# Altium schematic sheet USBhub-CH634M-R0-1v1.SchDoc
size A3
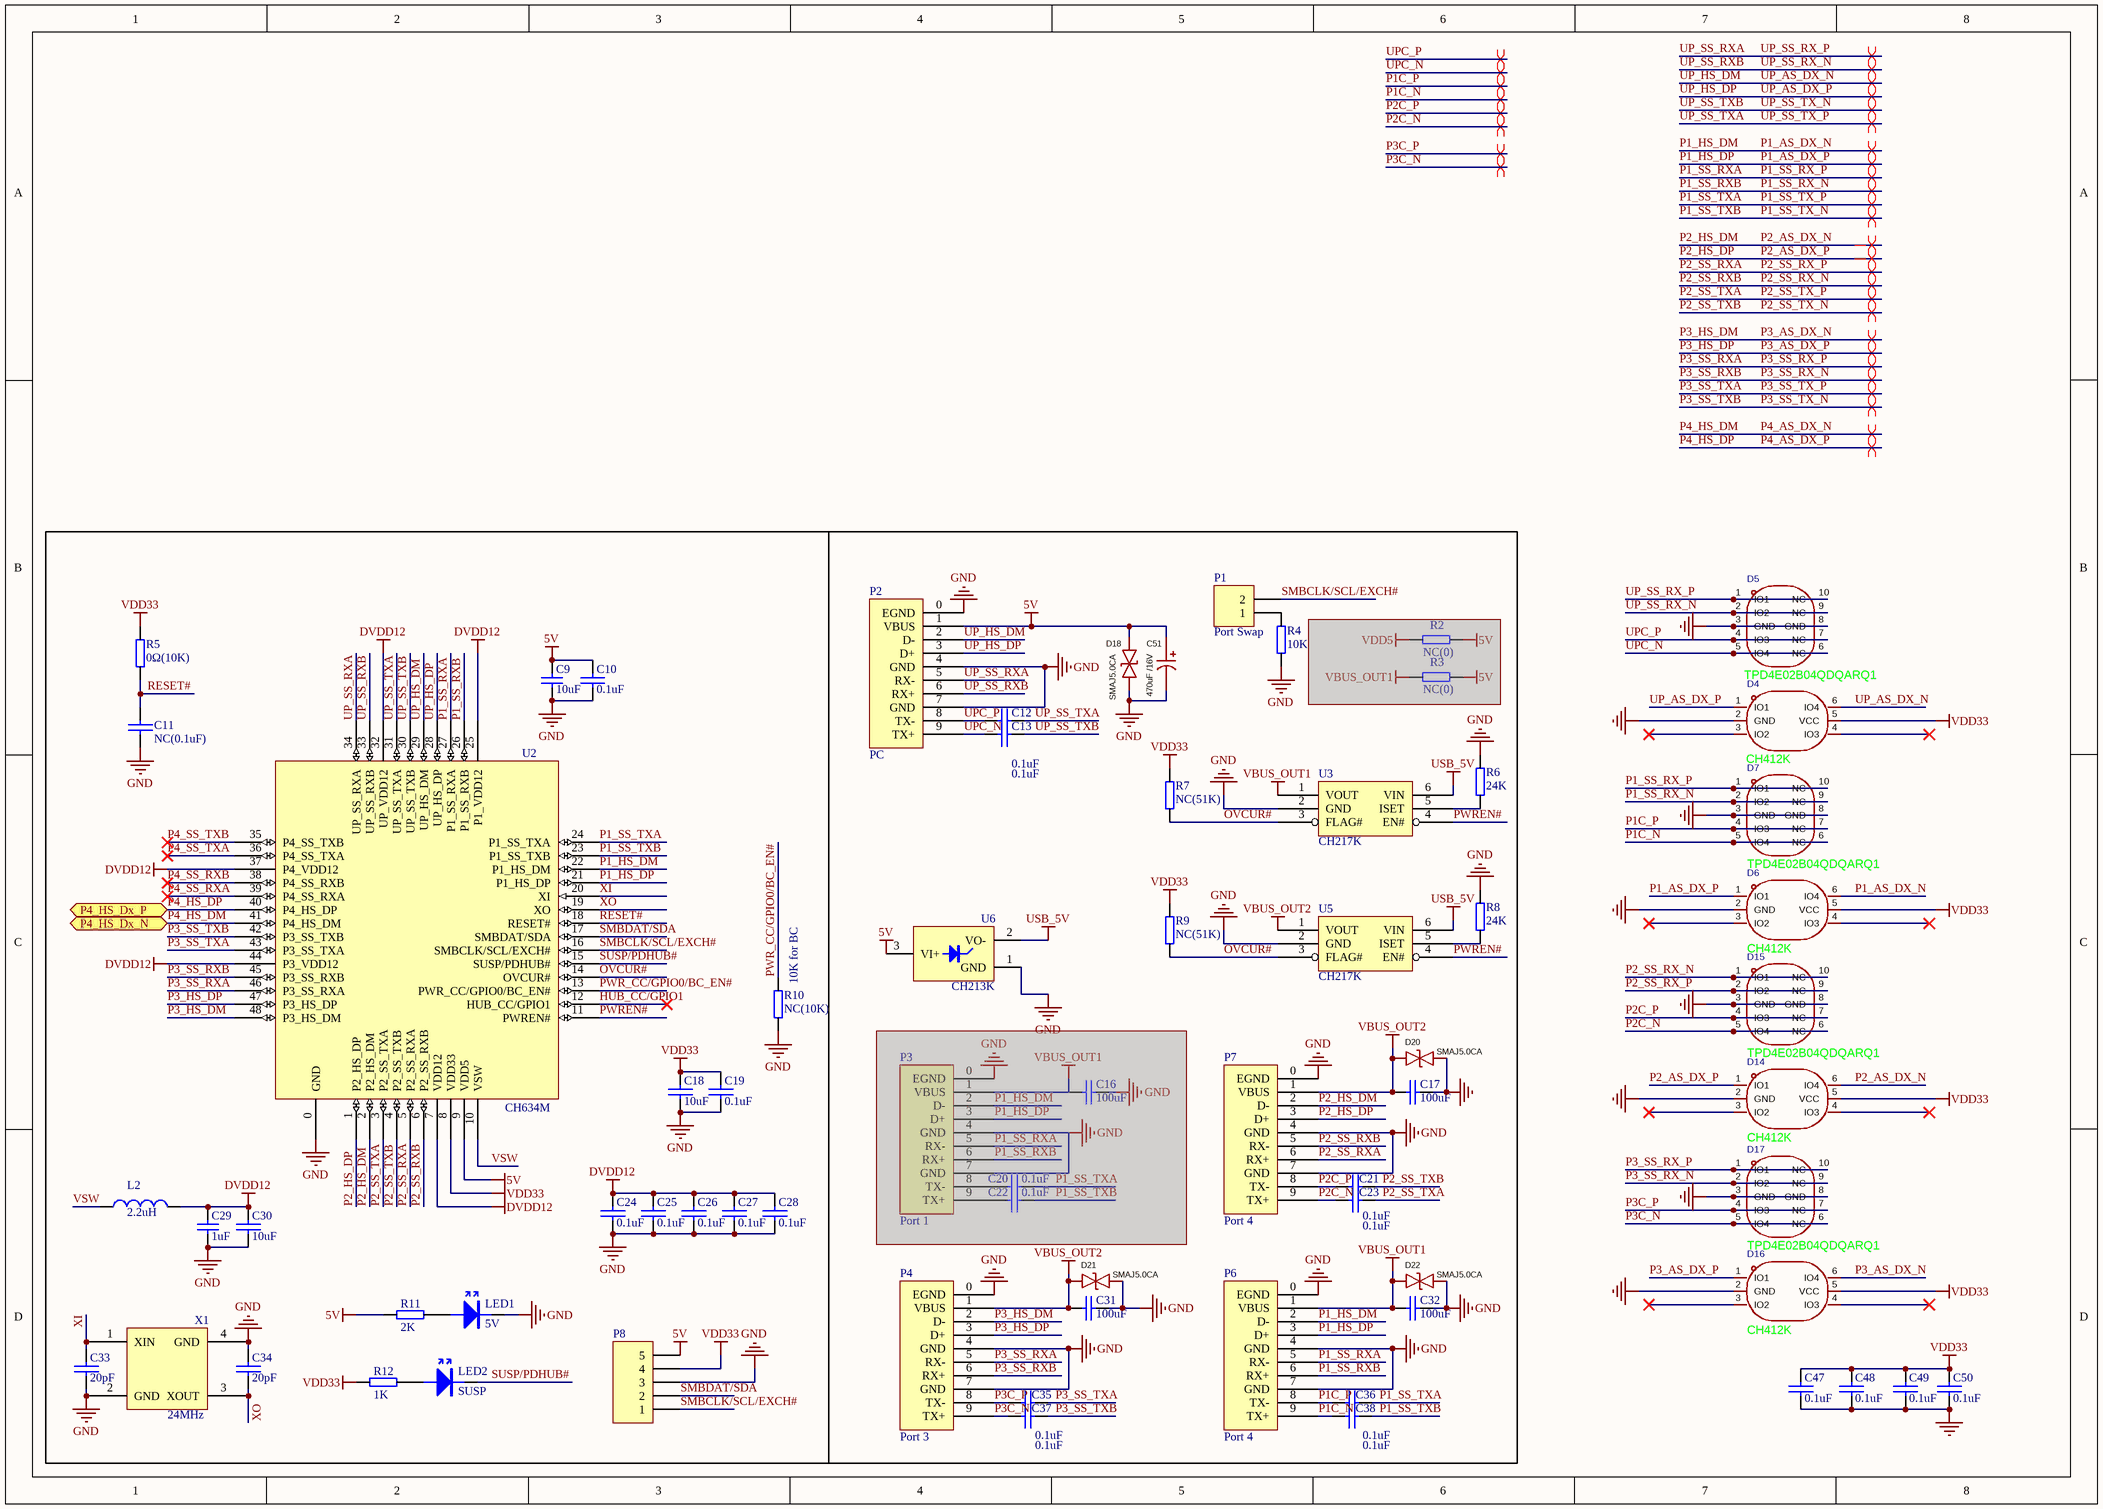
[diagram p0: USBhub-CH634M-R0-1v1.SchDoc]

## Parts
C9  10uF  [0603_C]
C10  0.1uF  [0402_C]
C11  NC(0.1uF)  [0402_C]
C12  0.1uF  [0402_C]
C13  0.1uF  [0402_C]
C16  100uF  [CD0.1]  (masked out: inside a compile mask, not in the netlist)
C17  100uF  [CD0.1]
C18  10uF  [0603_C]
C19  0.1uF  [0402_C]
C20  0.1uF  [0402_C]  (masked out: inside a compile mask, not in the netlist)
C21  0.1uF  [0402_C]
C22  0.1uF  [0402_C]  (masked out: inside a compile mask, not in the netlist)
C23  0.1uF  [0402_C]
C24  0.1uF  [0402_C]
C25  0.1uF  [0402_C]
C26  0.1uF  [0402_C]
C27  0.1uF  [0402_C]
C28  0.1uF  [0402_C]
C29  1uF  [0402_C]
C30  10uF  [0603_C]
C31  100uF  [CD0.1]
C32  100uF  [CD0.1]
C33  20pF  [0402_C]
C34  20pF  [0402_C]
C35  0.1uF  [0402_C]
C36  0.1uF  [0402_C]
C37  0.1uF  [0402_C]
C38  0.1uF  [0402_C]
C47  0.1uF  [0402_C]
C48  0.1uF  [0402_C]
C49  0.1uF  [0402_C]
C50  0.1uF  [0402_C]
C51  470uF /16V  [CAP-TH_BD8.0-P3.50-D0.6-FD]
D4  CH412K  [SOT-363_L2.0-W1.3-P0.65-LS2.1-BR]
D5  TPD4E02B04QDQARQ1  [USON-10_L2.5-W1.0-P0.50-BL]
D6  CH412K  [SOT-363_L2.0-W1.3-P0.65-LS2.1-BR]
D7  TPD4E02B04QDQARQ1  [USON-10_L2.5-W1.0-P0.50-BL]
D14  CH412K  [SOT-363_L2.0-W1.3-P0.65-LS2.1-BR]
D15  TPD4E02B04QDQARQ1  [USON-10_L2.5-W1.0-P0.50-BL]
D16  CH412K  [SOT-363_L2.0-W1.3-P0.65-LS2.1-BR]
D17  TPD4E02B04QDQARQ1  [USON-10_L2.5-W1.0-P0.50-BL]
D18  SMAJ5.0CA  [SMA_L4.4-W2.6-LS5.0-BI]
D20  SMAJ5.0CA  [SMA_L4.4-W2.6-LS5.0-BI]
D21  SMAJ5.0CA  [SMA_L4.4-W2.6-LS5.0-BI]
D22  SMAJ5.0CA  [SMA_L4.4-W2.6-LS5.0-BI]
L2  2.2uH  [CD32]
LED1  5V  [0603+]
LED2  SUSP  [0603+]
P1  Port Swap  [SIP2-2.54mm]
P2  PC  [USB3.0-A-Receptacle]
P3  Port 1  [USB3.0-A-Receptacle]  (masked out: inside a compile mask, not in the netlist)
P4  Port 3  [USB3.0-A-Receptacle]
P6  Port 4  [USB3.0-A-Receptacle]
P7  Port 4  [USB3.0-A-Receptacle]
P8  (no value)  [SIP5-2.54mm]
R2  NC(0)  [0402]  (masked out: inside a compile mask, not in the netlist)
R3  NC(0)  [0402]  (masked out: inside a compile mask, not in the netlist)
R4  10K  [0402]
R5  0Ω(10K)  [0402]
R6  24K  [0402]
R7  NC(51K)  [0402]
R8  24K  [0402]
R9  NC(51K)  [0402]
R10  NC(10K)  [0402]
R11  2K  [0402]
R12  1K  [0402]
U2  CH634M  [QFN48_5X5]
U3  CH217K  [SOT-23-6]
U5  CH217K  [SOT-23-6]
U6  CH213K  [SOT-23-3]
X1  24MHz  [XT3225]

## Blocks framed on the sheet
10K for BC: C9-C13 C16-C38 C51 D18 D20-D22 L2 LED1 LED2 P1-P4 P6-P8 R2-R12 U2 U3 U5 U6 X1

## Ports
P4_HS_Dx_N (bidir), P4_HS_Dx_P (bidir)

## Nets
5V: C9.2 C10.2 C51.1 D18.2 P2.1(VBUS) P8.5 R11.2 U2.9(VDD5) U6.3(VI+)
DVDD12: C24.2 C25.2 C26.2 C27.2 C28.2 C29.2 C30.1 L2.2 U2.7(VDD12) U2.25(P1_VDD12) U2.32(UP_VDD12) U2.37(P4_VDD12) U2.44(P3_VDD12)
GND: C9.1 C10.1 C11.1 C17.2 C18.2 C19.1 C24.1 C25.1 C26.1 C27.1 C28.1 C29.1 C30.2 C31.2 C32.2 C33.2 C34.1 C47.1 C48.1 C49.1 C50.1 C51.2 D4.2(GND) D5.3(GND) D5.8(GND) D6.2(GND) D7.3(GND) D7.8(GND) D14.2(GND) D15.3(GND) D15.8(GND) D16.2(GND) D17.3(GND) D17.8(GND) D18.1 D20.1 D21.1 D22.1 LED1.2(K) P2.0(EGND) P2.4(GND) P2.7(GND) P4.0(EGND) P4.4(GND) P4.7(GND) P6.0(EGND) P6.4(GND) P6.7(GND) P7.0(EGND) P7.4(GND) P7.7(GND) P8.3 R4.2 R6.2 R8.2 R10.1 U2.0(GND) U3.2(GND) U5.2(GND) U6.1(GND) X1.2(GND) X1.4(GND)
USB_5V: U3.6(VIN) U5.6(VIN) U6.2(VO-)
VBUS_OUT1: C32.1 D22.2 P6.1(VBUS) U3.1(VOUT)
VBUS_OUT2: C17.1 C31.1 D20.2 D21.2 P4.1(VBUS) P7.1(VBUS) U5.1(VOUT)
VDD33: C18.1 C19.2 C47.2 C48.2 C49.2 C50.2 D4.5(VCC) D6.5(VCC) D14.5(VCC) D16.5(VCC) P8.4 R5.2 R7.1 R9.1 R12.2 U2.8(VDD33)
HUB_CC/GPIO1: U2.12(HUB_CC/GPIO1)
OVCUR#: R7.2 R9.2 U2.14(OVCUR#) U3.3(FLAG#) U5.3(FLAG#)
P1_AS_DX_N: D6.6(IO4) P6.2(D-) U2.22(P1_HS_DM)  [also labelled P1_HS_DM]
P1_AS_DX_P: D6.1(IO1) P6.3(D+) U2.21(P1_HS_DP)  [also labelled P1_HS_DP]
P1_SS_RX_N: D7.2(IO2) D7.9(NC) P6.6(RX+) U2.26(P1_SS_RXB)  [also labelled P1_SS_RXB]
P1_SS_RX_P: D7.1(IO1) D7.10(NC) P6.5(RX-) U2.27(P1_SS_RXA)  [also labelled P1_SS_RXA]
P1_SS_TX_N: C38.2 U2.23(P1_SS_TXB)  [also labelled P1_SS_TXB]
P1_SS_TX_P: C36.2 U2.24(P1_SS_TXA)  [also labelled P1_SS_TXA]
P1C_N: C38.1 D7.5(IO4) D7.6(NC) P6.9(TX+)
P1C_P: C36.1 D7.4(IO3) D7.7(NC) P6.8(TX-)
P2_AS_DX_N: D14.6(IO4) P7.2(D-) U2.2(P2_HS_DM)  [also labelled P2_HS_DM]
P2_AS_DX_P: D14.1(IO1) P7.3(D+) U2.1(P2_HS_DP)  [also labelled P2_HS_DP]
P2_SS_RX_N: D15.1(IO1) D15.10(NC) P7.5(RX-) U2.6(P2_SS_RXB)  [also labelled P2_SS_RXB]
P2_SS_RX_P: D15.2(IO2) D15.9(NC) P7.6(RX+) U2.5(P2_SS_RXA)  [also labelled P2_SS_RXA]
P2_SS_TX_N: C21.2 U2.4(P2_SS_TXB)  [also labelled P2_SS_TXB]
P2_SS_TX_P: C23.2 U2.3(P2_SS_TXA)  [also labelled P2_SS_TXA]
P2C_N: C23.1 D15.5(IO4) D15.6(NC) P7.9(TX+)
P2C_P: C21.1 D15.4(IO3) D15.7(NC) P7.8(TX-)
P3_AS_DX_N: D16.6(IO4) P4.2(D-) U2.48(P3_HS_DM)  [also labelled P3_HS_DM]
P3_AS_DX_P: D16.1(IO1) P4.3(D+) U2.47(P3_HS_DP)  [also labelled P3_HS_DP]
P3_SS_RX_N: D17.2(IO2) D17.9(NC) P4.6(RX+) U2.45(P3_SS_RXB)  [also labelled P3_SS_RXB]
P3_SS_RX_P: D17.1(IO1) D17.10(NC) P4.5(RX-) U2.46(P3_SS_RXA)  [also labelled P3_SS_RXA]
P3_SS_TX_N: C37.2 U2.42(P3_SS_TXB)  [also labelled P3_SS_TXB]
P3_SS_TX_P: C35.2 U2.43(P3_SS_TXA)  [also labelled P3_SS_TXA]
P3C_N: C37.1 D17.5(IO4) D17.6(NC) P4.9(TX+)
P3C_P: C35.1 D17.4(IO3) D17.7(NC) P4.8(TX-)
P4_AS_DX_N: U2.41(P4_HS_DM) ; port P4_HS_Dx_N  [also labelled P4_HS_DM]
P4_AS_DX_P: U2.40(P4_HS_DP) ; port P4_HS_Dx_P  [also labelled P4_HS_DP]
P4_SS_RXA: U2.39(P4_SS_RXA)
P4_SS_RXB: U2.38(P4_SS_RXB)
P4_SS_TXA: U2.36(P4_SS_TXA)
P4_SS_TXB: U2.35(P4_SS_TXB)
PWR_CC/GPIO0/BC_EN#: R10.2 U2.13(PWR_CC/GPIO0/BC_EN#)
PWREN#: U2.11(PWREN#) U3.4(EN#) U5.4(EN#)
RESET#: C11.2 R5.1 U2.18(RESET#)
SMBCLK/SCL/EXCH#: P1.2 P8.1 U2.16(SMBCLK/SCL/EXCH#)
SMBDAT/SDA: P8.2 U2.17(SMBDAT/SDA)
SUSP/PDHUB#: LED2.2(K) U2.15(SUSP/PDHUB#)
UP_AS_DX_N: D4.6(IO4) P2.2(D-) U2.29(UP_HS_DM)  [also labelled UP_HS_DM]
UP_AS_DX_P: D4.1(IO1) P2.3(D+) U2.28(UP_HS_DP)  [also labelled UP_HS_DP]
UP_SS_RX_N: D5.2(IO2) D5.9(NC) P2.6(RX+) U2.33(UP_SS_RXB)  [also labelled UP_SS_RXB]
UP_SS_RX_P: D5.1(IO1) D5.10(NC) P2.5(RX-) U2.34(UP_SS_RXA)  [also labelled UP_SS_RXA]
UP_SS_TX_N: C13.2 U2.30(UP_SS_TXB)  [also labelled UP_SS_TXB]
UP_SS_TX_P: C12.2 U2.31(UP_SS_TXA)  [also labelled UP_SS_TXA]
UPC_N: C13.1 D5.5(IO4) D5.6(NC) P2.9(TX+)
UPC_P: C12.1 D5.4(IO3) D5.7(NC) P2.8(TX-)
VSW: L2.1 U2.10(VSW)
XI: C33.1 U2.20(XI) X1.1(XIN)
XO: C34.2 U2.19(XO) X1.3(XOUT)
NetLED1_1: LED1.1(A) R11.1
NetLED2_1: LED2.1(A) R12.1
NetP1_1: P1.1 R4.1
NetR6_1: R6.1 U3.5(ISET)
NetR8_1: R8.1 U5.5(ISET)

Not connected (* = marked no-connect by the designer): D4 3(IO2)* 4(IO3)*; D6 3(IO2)* 4(IO3)*; D14 3(IO2)* 4(IO3)*; D16 3(IO2)* 4(IO3)*

## Layout directives
differential pair: P1_AS_DX_N, P1_AS_DX_P, P1_SS_RX_N, P1_SS_RX_P, P1_SS_TX_N, P1_SS_TX_P, P1C_N, P1C_P, P2_AS_DX_N, P2_AS_DX_P, P2_SS_RX_N, P2_SS_RX_P, P2_SS_TX_N, P2_SS_TX_P, P2C_N, P2C_P, P3_AS_DX_N, P3_AS_DX_P, P3_SS_RX_N, P3_SS_RX_P, P3_SS_TX_N, P3_SS_TX_P, P3C_N, P3C_P, P4_AS_DX_N, P4_AS_DX_P, UP_AS_DX_N, UP_AS_DX_P, UP_SS_RX_N, UP_SS_RX_P, UP_SS_TX_N, UP_SS_TX_P, UPC_N, UPC_P

## Library data of the parts
C9 C29 = Cap: Capacitor; Published: 8-Jun-2000; LatestRevisionDate: 17-Jul-2002; LatestRevisionNote: Re-released for DXP Platform.; PackageReference: RAD-0.3; Publisher: Altium Limited; PackageDescription: Radial Cap, Thru-Hole; 2 Leads; 0.3 in Pin Spacing
C10-C13 C16-C28 C30-C38 C47-C50 = CAP: Capacitor
C51 = JBLE2471M016D090RLM 470UF 16V: Add into BOM: yes; Rated Voltage: 16V; Ripple Current: 3.7A@100kHz; Symbol: JBLE2471M016D090RLM 470UF 16V; Device: JBLE2471M016D090RLM 470UF 16V; Supplier Part: C19270650; Manufacturer Part: JBLE2471M016D090RLM 470UF 16V; JLCPCB Part Class: Extended Part; Datasheet: https://atta.szlcsc.com/upload/public/pdf/source/20240115/1E5B34C3EFC94403EAAAB66897201DA6.pdf; Supplier: LCSC; Convert to PCB: yes; Value: 470uF
D18 D20-D22 = SMAJ5.0CA_C83324: Symbol: SMAJ5.0CA-C83324; Add into BOM: yes; Reverse Stand-Off Voltage (Vrwm): 5V; Maximum Clamping Voltage: 9.2V; Peak Pulse Current (Ipp)@10/1000us: 43.5A; Peak Pulse Power Dissipation (Ppp)@10/1000us: 400W; Breakdown Voltage: 6.4V; Type: TVS; Device: SMAJ5.0CA_C83324; Supplier Part: C83324; Manufacturer Part: SMAJ5.0CA; Supplier Footprint: SMA(DO-214AC); JLCPCB Part Class: Extended Part; Datasheet: https://atta.szlcsc.com/upload/public/pdf/source/20190402/C374025_5ACE77BC72947DF13CF0CBC7F8B57228.pdf; Supplier: LCSC; Convert to PCB: yes
L2 = Inductor: Code_IEC: 1005; Published: 8-Jun-2000; LatestRevisionDate: 29-May-2009; LatestRevisionNote: IPC-7351 Footprint Added.; PackageReference: 0402-A; Publisher: Altium Limited; PackageDescription: Chip Inductor; Code_JEITA: 0402
LED1 LED2 = LED
P1 = HEADER 2: Header, 2-Pin
P2-P4 P6 P7 = USB-AF3.0-90卷
P8 = HEADER 5: Header, 5-Pin
R2-R12 = RES
U2 = CH634M: 4 ports USB 3.0 SS hub
U3 U5 = CH217K: Current-Limited USB Power Distribution Switch
U6 = CH213K: Ideal Diode 5V*1A
X1 = 晶体
D4 D6 D14 D16 = CH412K: Symbol: CH412K
D5 D7 D15 D17 = TPD4E02B04QDQARQ1: Symbol: TPD4E02B04QDQARQ1